# Altium project PCB_Project.PrjPcb
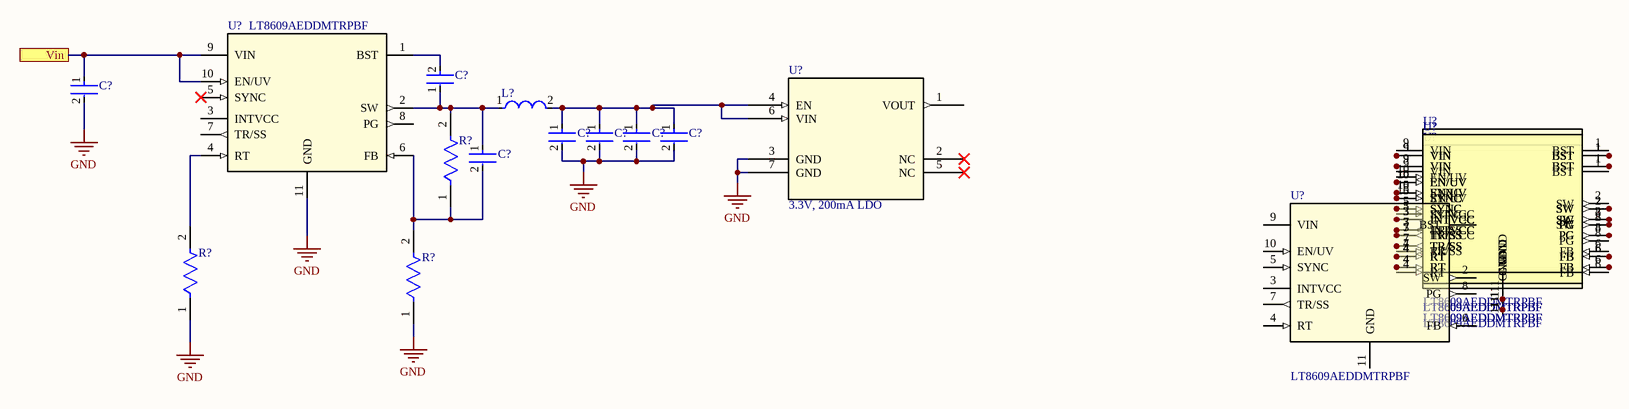
[diagram p0: LV_Conversion.SchDoc]
2 sheets, 25 parts. Net scope: flat (ports and power ports of the same name join across sheets).
Sheets:
  MCU.SchDoc
  LV_Conversion.SchDoc

## Sheet MCU.SchDoc
size A; SheetNumber: 1; SheetTotal: 1

## Sheet LV_Conversion.SchDoc
size A; SheetNumber: 2; SheetTotal: 2

### Parts
(Parts that share a designator on the sheet are numbered #1, #2 ... from top to bottom, then left to right.)
C?#1  GCJ188R91H104KA01D  [FP-GCJ188-0_2-IPC_C]  (value not drawn)
C?#2  GRM188R6YA475ME15D  [FP-GRM188-0_2-MFG]  (value not drawn)
C?#3  GRT31CR6YA106KE01L  [FP-GRT31C-0_2-IPC_A]  (value not drawn)
C?#4  GRT31CR6YA106KE01L  [FP-GRT31C-0_2-IPC_A]  (value not drawn)
C?#5  GRT31CR6YA106KE01L  [FP-GRT31C-0_2-IPC_A]  (value not drawn)
C?#6  GRT31CR6YA106KE01L  [FP-GRT31C-0_2-IPC_A]  (value not drawn)
C?#7  GRT31CR6YA106KE01L  [FP-GRT31C-0_2-IPC_A]  (value not drawn)
L?  NRS4018T150MDGJ  [FP-NR4018-MFG]  (value not drawn)
R?#1  KTR03EZPJ1R0  [FP-KTR03-IPC_B]  (value not drawn)
R?#2  AC0603FR-0718K2L  [FP-AC0603-IPC_B]  (value not drawn)
R?#3  CRCW0603187KFKEA  [FP-CRCW0603-e3-IPC_A]  (value not drawn)
U?#1  LT8609AEDDMTRPBF  [10-WDFN]
U?#2  3.3V, 200mA LDO  [LFCSP-UD (2x2)]
U?#3  LT8609AEDDMTRPBF  [10-WDFN]
U?#4  LT8609AEDDMTRPBF  [10-WDFN]
U?#5  LT8609AEDDMTRPBF  [10-WDFN]
U?#6  LT8609AEDDMTRPBF  [10-WDFN]
U?#7  LT8609AEDDMTRPBF  [10-WDFN]
U?#8  LT8609AEDDMTRPBF  [10-WDFN]
U?#9  LT8609AEDDMTRPBF  [10-WDFN]
U?#10  LT8609AEDDMTRPBF  [10-WDFN]
U?#11  LT8609AEDDMTRPBF  [10-WDFN]
U?#12  LT8609AEDDMTRPBF  [10-WDFN]
U?#13  LT8609AEDDMTRPBF  [10-WDFN]
U?#14  LT8609AEDDMTRPBF  [10-WDFN]

### Ports
Vin

### Nets
GND: C?#2.2 C?#3.2 C?#4.2 C?#5.2 C?#6.2 R?#2.1 R?#3.1 U?#1.11(GND) U?#2.3(GND) U?#2.7(GND)
NetC?#1_1: C?#1.1 C?#7.1 L?.1 R?#1.2 U?#1.2(SW)
NetC?#1_2: C?#1.2 U?#1.1(BST)
NetC?#2_1: C?#2.1 U?#1.9(VIN) U?#1.10(EN/UV) ; port Vin
NetC?#3_1: C?#3.1 C?#4.1 C?#5.1 C?#6.1 L?.2 U?#2.4(EN) U?#2.6(VIN)
NetC?#7_2: C?#7.2 R?#1.1 R?#3.2 U?#1.6(FB)
NetR?#2_2: R?#2.2 U?#1.4(RT)
NetU?#3_3: U?#3.3(INTVCC) U?#13.5(SYNC)
NetU?#3_4: U?#3.4(RT) U?#13.7(TR/SS)
NetU?#3_5: U?#3.5(SYNC) U?#10.10(EN/UV) U?#11.10(EN/UV) U?#12.10(EN/UV)
NetU?#3_7: U?#3.7(TR/SS) U?#10.3(INTVCC) U?#11.3(INTVCC) U?#12.3(INTVCC)
NetU?#3_8: U?#3.8(PG) U?#10.2(SW) U?#11.2(SW) U?#12.2(SW)
NetU?#4_1: U?#4.1(BST) U?#5.1(BST) U?#6.1(BST) U?#7.1(BST) U?#8.1(BST) U?#9.1(BST)
NetU?#4_2: U?#4.2(SW) U?#5.2(SW) U?#6.2(SW) U?#7.2(SW) U?#8.2(SW) U?#9.2(SW)
NetU?#4_3: U?#4.3(INTVCC) U?#5.3(INTVCC) U?#6.3(INTVCC) U?#7.3(INTVCC) U?#8.3(INTVCC) U?#9.3(INTVCC)
NetU?#4_4: U?#4.4(RT) U?#5.4(RT) U?#6.4(RT) U?#7.4(RT) U?#8.4(RT) U?#9.4(RT)
NetU?#4_5: U?#4.5(SYNC) U?#5.5(SYNC) U?#6.5(SYNC) U?#7.5(SYNC) U?#8.5(SYNC) U?#9.5(SYNC) U?#13.10(EN/UV)
NetU?#4_6: U?#4.6(FB) U?#5.6(FB) U?#6.6(FB) U?#7.6(FB) U?#8.6(FB) U?#9.6(FB)
NetU?#4_7: U?#4.7(TR/SS) U?#5.7(TR/SS) U?#6.7(TR/SS) U?#7.7(TR/SS) U?#8.7(TR/SS) U?#9.7(TR/SS) U?#13.3(INTVCC)
NetU?#4_8: U?#4.8(PG) U?#5.8(PG) U?#6.8(PG) U?#7.8(PG) U?#8.8(PG) U?#9.8(PG) U?#13.2(SW)
NetU?#4_9: U?#4.9(VIN) U?#5.9(VIN) U?#6.9(VIN) U?#7.9(VIN) U?#8.9(VIN) U?#9.9(VIN)
NetU?#4_10: U?#4.10(EN/UV) U?#5.10(EN/UV) U?#6.10(EN/UV) U?#7.10(EN/UV) U?#8.10(EN/UV) U?#9.10(EN/UV)
NetU?#4_11: U?#4.11(GND) U?#5.11(GND) U?#6.11(GND) U?#7.11(GND) U?#8.11(GND) U?#9.11(GND)
NetU?#10_1: U?#10.1(BST) U?#11.1(BST) U?#12.1(BST)
NetU?#10_4: U?#10.4(RT) U?#11.4(RT) U?#12.4(RT)
NetU?#10_5: U?#10.5(SYNC) U?#11.5(SYNC) U?#12.5(SYNC)
NetU?#10_6: U?#10.6(FB) U?#11.6(FB) U?#12.6(FB)
NetU?#10_7: U?#10.7(TR/SS) U?#11.7(TR/SS) U?#12.7(TR/SS)
NetU?#10_8: U?#10.8(PG) U?#11.8(PG) U?#12.8(PG)
NetU?#10_9: U?#10.9(VIN) U?#11.9(VIN) U?#12.9(VIN)
NetU?#10_11: U?#10.11(GND) U?#11.11(GND) U?#12.11(GND)

Not connected (* = marked no-connect by the designer): U?#1 3(INTVCC) 5(SYNC)* 7(TR/SS) 8(PG); U?#2 1(VOUT) 2(NC)* 5(NC)*; U?#3 1(BST) 2(SW) 6(FB) 9(VIN) 10(EN/UV) 11(GND); U?#13 1(BST) 4(RT) 6(FB) 8(PG) 9(VIN) 11(GND); U?#14 1(BST) 2(SW) 3(INTVCC) 4(RT) 5(SYNC) 6(FB) 7(TR/SS) 8(PG) 9(VIN) 10(EN/UV) 11(GND)

### Library data of the parts
C?#1 = CMP-06035-008275-1: Cap Ceramic 0.1uF 50V X8R 10% Pad SMD 0603 Soft Termination +150°C Automotive T/R; Capacitance: 100nF; Voltage Rating: 50V; Min Operating Temperature: -55°C; Max Operating Temperature: 150°C; Case/Package: 0603; Tolerance: 10%; Packaging: Tape and Reel; Features: Soft Termination; Ratings: AEC-Q200; Mount: Surface Mount; Case Code (Metric): 1608; Case Code (Imperial): 0603; Lead Free: Lead Free
C?#2 = CMP-06035-058411-1: Chip Multilayer Ceramic Capacitors for General Purpose, 0603, 4.7uF, X5R, 15%, 20%, 35V; Voltage Rating (DC): 35V; Capacitance: 4.7uF; Dielectric: X5R; Case/Package: 0603; Min Operating Temperature: -55°C; Weight: 0.000222oz; Tolerance: 20%; Termination: SMD/SMT; Case Code (Imperial): 0603; Resistor Type: Ceramic; Thickness: 0.039inch; Case Code (Metric): 1608; Width: 0.8mm; Max Operating Temperature: 85°C; Mount: Surface Mount; Length: 0.063inch; Package Quantity: 4000; Height: 0.8mm; Voltage Rating: 35V; Packaging: Tape and Reel
C?#3-C?#7 = CMP-06035-017590-1: Multi-Layer Ceramic Capacitor 10uF 35V X5R ±10% 1206 Emboss T/R; Capacitance: 10uF; Width: 0.063inch; Tolerance: 10%; Ratings: AEC-Q200; Packaging: Tape and Reel; Min Operating Temperature: -55°C; Case Code (Imperial): 1206; Voltage Rating: 35V; Case/Package: 1206; Max Operating Temperature: 85°C; Thickness: 0.071inch; Case Code (Metric): 3216; Mount: Surface Mount; Length: 0.126inch
L? = CMP-14484-001457-1: SMD Power Inductors 15uH ±20% 0.85A 0.252Ω; Shielding: Shielded; Self Resonant Frequency: 18MHz; Saturation Current: 1.1A; Test Frequency: 100kHz; Core Material: Ferrite; Max DC Current: 850mA; DC Resistance (DCR): 252mR; Depth: 4.2mm; Lead Free: Lead Free; Termination: SMD/SMT; Halogen Free: Halogen Free; Package Quantity: 3500; Length: 4mm; Radiation Hardening: No; Inductance: 15uH; Series: NRS; Tolerance: 20%; Height: 1.8mm; Resistor Type: Wirewound; REACH SVHC: No SVHC; Min Operating Temperature: -25°C; Max Operating Temperature: 125°C; Packaging: Tape and Reel; Case/Package: 4018; Width: 0.157inch; Lead Pitch: 2.8mm; Number of Pins: 2; RMS Current (Irms): 850mA; Mount: Surface Mount; Inductance Tolerance: 20%; Current Rating: 850mA; Height - Seated (Max): 0.071inch
R?#1 = CMP-08839-031774-1: Res Thick Film 0603 1Ω 5% 0.1W ±200ppm/°C Automotive Paper T/R; Resistance: 1R; Max Power Dissipation: 100mW; Temperature Coefficient: 200ppm/°C; Series: KTR; Case Code (Metric): 1608; RoHS Compliant: Yes; Case/Package: 0603; Number of Terminations: 2; Width: 0.031inch; Length: 0.063inch; Features: Automotive AEC-Q200; Package Quantity: 5000; Tolerance: 5%; Max Operating Temperature: 155°C; Min Operating Temperature: -55°C; Height: 0.022inch; Case Code (Imperial): 0603; Resistor Type: Thick Film; Packaging: Tape and Reel
R?#2 = CMP-03412-025771-2: RES 18.2KΩ 1.00% 0.1W 0603; Resistance: 18.2kR; Temperature Coefficient: 100ppm/°C; Power Rating: 100mW; Tolerance: 1%; Voltage Rating: 50V; Case Code (Imperial): 0603; Min Operating Temperature: -55°C; Packaging: Tape and Reel; Case Code (Metric): 1608; Length: 0.063inch; Width: 0.8mm; Resistor Type: Thick Film; RoHS Compliant: Yes; Series: AC; Max Power Dissipation: 100mW; Number of Terminations: 2; Height: 0.022inch; Weight: 7.1E-05oz; Features: Moisture Resistant; Termination: SMD/SMT; Case/Package: 0603; Max Operating Temperature: 155°C
R?#3 = CMP-2000-02956-2: RES Thick Film, 187kΩ, 1%, 0.1W, 100ppm/°C, 0603; Voltage Rating (DC): 75V; Max Power Dissipation: 100mW; Resistance: 187kR; Temperature Coefficient: 100ppm/°C; Voltage Rating: 75V; Case Code (Imperial): 0603; Case Code (Metric): 1608; Tolerance: 1%; Features: Automotive AEC-Q200; Military Standard: Not; Case/Package: 0603; Max Operating Temperature: 155°C; Width: 0.033inch; Number of Terminations: 2; Packaging: Tape and Reel; Lead Free: Lead Free; Min Operating Temperature: -55°C; Termination: SMD/SMT; Contact Plating: Tin; Weight: 7.1E-05oz; Length: 1.55mm; Package Quantity: 10; Power Rating: 100mW; Number of Pins: 2; Composition: Thick Film; Depth: 0.85mm; Height: 0.45mm; Radiation Hardening: No
U?#1 U?#3-U?#14 = LT8609AEDDMTRPBF: Buck Switching Regulator IC Positive Adjustable 0.782V 1 Output 3A 10-WFDFN Exposed Pad; ComponentLink1Description: Digikey; ComponentLink1URL: https://www.digikey.com/en/products/detail/analog-devices-inc/LT8609AEDDM-TRPBF/10668739; ComponentLink2Description: Datasheet; ComponentLink2URL: https://www.analog.com/media/en/technical-documentation/data-sheets/LT8609-8609A-8609B.pdf
U?#2 = ADPL40502ACPZ-3P3-R7